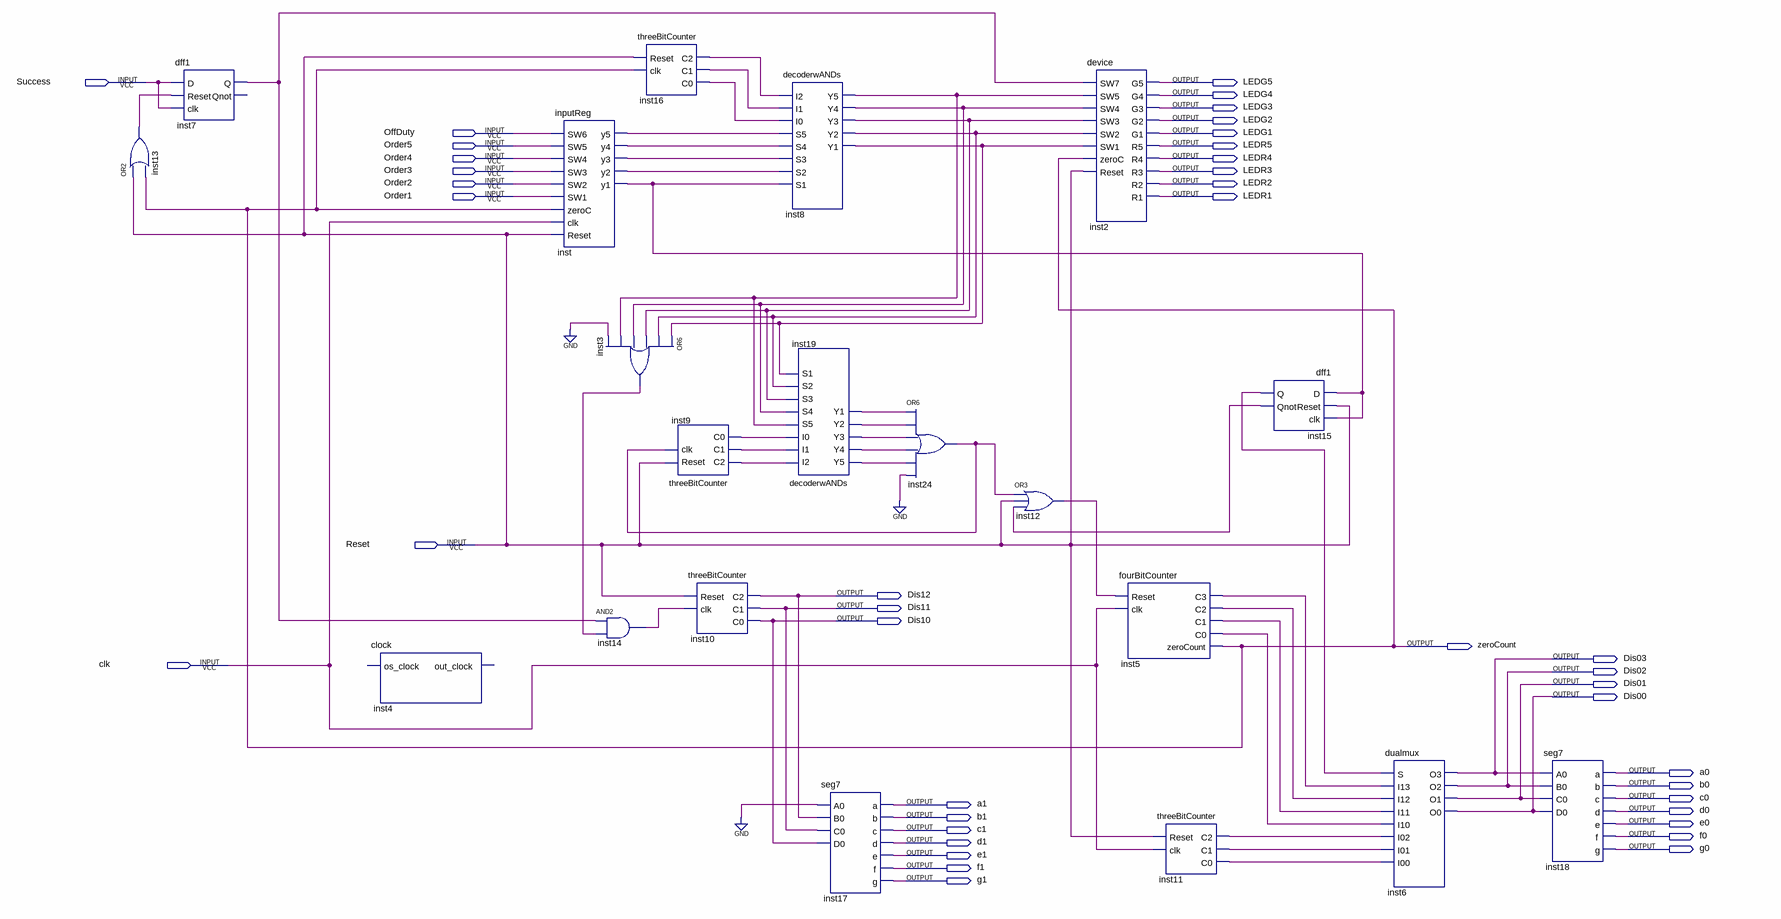
[diagram p0: schematic sheet]
// Quartus schematic circuit1.bdf as structural Verilog: 20 symbols, 41 pins
module circuit1 (
  input  Success,
  input  OffDuty,
  input  Order5,
  input  Order4,
  input  Order3,
  input  Order2,
  input  Order1,
  input  Reset,
  input  clk,
  output LEDG5,
  output LEDG4,
  output LEDG3,
  output LEDG2,
  output LEDG1,
  output LEDR5,
  output LEDR4,
  output LEDR3,
  output LEDR2,
  output LEDR1,
  output Dis12,
  output Dis11,
  output Dis10,
  output zeroCount,
  output Dis03,
  output Dis02,
  output Dis01,
  output Dis00,
  output a0,
  output b0,
  output c0,
  output a1,
  output d0,
  output b1,
  output e0,
  output c1,
  output f0,
  output d1,
  output g0,
  output e1,
  output f1,
  output g1
);

  wire inst3_out, inst5_c0, inst5_c1, inst5_c2, inst5_c3, inst7_q, inst8_y1, inst8_y2, inst8_y3, inst8_y4,
       inst8_y5, inst9_c0, inst9_c1, inst9_c2, inst11_c0, inst11_c1, inst11_c2, inst12_out, inst13_out,
       inst14_out, inst15_q, inst15_qnot, inst16_c0, inst16_c1, inst16_c2, inst19_y1, inst19_y2, inst19_y3,
       inst19_y4, inst19_y5, inst24_out, inst_y1, inst_y2, inst_y3, inst_y4, inst_y5;

  or inst13 (inst13_out, Reset, zeroCount);
  dff1 inst7 (.D(Success), .Reset(inst13_out), .clk(Success), .Q(inst7_q));  // open: Qnot
  clock inst4 ();  // open: os_clock, out_clock
  inputReg inst (
    .SW6(OffDuty), .SW5(Order5), .SW4(Order4), .SW3(Order3), .SW2(Order2), .SW1(Order1), .zeroC(zeroCount),
    .clk(clk), .Reset(Reset), .y5(inst_y5), .y4(inst_y4), .y3(inst_y3), .y2(inst_y2), .y1(inst_y1));
  or inst3 (inst3_out, inst8_y1, inst8_y2, inst8_y3, inst8_y4, inst8_y5, 1'b0);
  and inst14 (inst14_out, inst7_q, inst3_out);
  threeBitCounter inst16 (.Reset(Reset), .clk(zeroCount), .C2(inst16_c2), .C1(inst16_c1), .C0(inst16_c0));
  threeBitCounter inst9 (.Reset(Reset), .clk(inst24_out), .C2(inst9_c2), .C1(inst9_c1), .C0(inst9_c0));
  threeBitCounter inst10 (.Reset(Reset), .clk(inst14_out), .C2(Dis12), .C1(Dis11), .C0(Dis10));
  decoderwANDs inst8 (
    .I2(inst16_c2), .I1(inst16_c1), .I0(inst16_c0), .S5(inst_y5), .S4(inst_y4), .S3(inst_y3), .S2(inst_y2),
    .S1(inst_y1), .Y5(inst8_y5), .Y4(inst8_y4), .Y3(inst8_y3), .Y2(inst8_y2), .Y1(inst8_y1));
  decoderwANDs inst19 (
    .I2(inst9_c2), .I1(inst9_c1), .I0(inst9_c0), .S5(inst8_y5), .S4(inst8_y4), .S3(inst8_y3), .S2(inst8_y2),
    .S1(inst8_y1), .Y5(inst19_y5), .Y4(inst19_y4), .Y3(inst19_y3), .Y2(inst19_y2), .Y1(inst19_y1));
  seg7 inst17 (.A0(1'b0), .B0(Dis12), .C0(Dis11), .D0(Dis10), .a(a1), .b(b1), .c(c1), .d(d1), .e(e1), .f(f1), .g(g1));
  or inst24 (inst24_out, inst19_y1, inst19_y2, inst19_y3, inst19_y4, inst19_y5, 1'b0);
  or inst12 (inst12_out, inst24_out, Reset, inst15_qnot);
  device inst2 (
    .SW7(inst7_q), .SW5(inst8_y5), .SW4(inst8_y4), .SW3(inst8_y3), .SW2(inst8_y2), .SW1(inst8_y1),
    .zeroC(zeroCount), .Reset(Reset), .G5(LEDG5), .G4(LEDG4), .G3(LEDG3), .G2(LEDG2), .G1(LEDG1), .R5(LEDR5),
    .R4(LEDR4), .R3(LEDR3), .R2(LEDR2), .R1(LEDR1));
  fourBitCounter inst5 (
    .Reset(inst12_out), .clk(clk), .C3(inst5_c3), .C2(inst5_c2), .C1(inst5_c1), .C0(inst5_c0),
    .zeroCount(zeroCount));
  threeBitCounter inst11 (.Reset(Reset), .clk(clk), .C2(inst11_c2), .C1(inst11_c1), .C0(inst11_c0));
  dff1 inst15 (.D(inst_y1), .Reset(Reset), .clk(inst_y1), .Q(inst15_q), .Qnot(inst15_qnot));
  dualmux inst6 (
    .S(inst15_q), .I13(inst5_c3), .I12(inst5_c2), .I11(inst5_c1), .I10(inst5_c0), .I02(inst11_c2),
    .I01(inst11_c1), .I00(inst11_c0), .O3(Dis03), .O2(Dis02), .O1(Dis01), .O0(Dis00));
  seg7 inst18 (.A0(Dis03), .B0(Dis02), .C0(Dis01), .D0(Dis00), .a(a0), .b(b0), .c(c0), .d(d0), .e(e0), .f(f0), .g(g0));
endmodule
